# Altium schematic sheet main.SchDoc
size A3; SheetNumber: 1; SheetTotal: 3
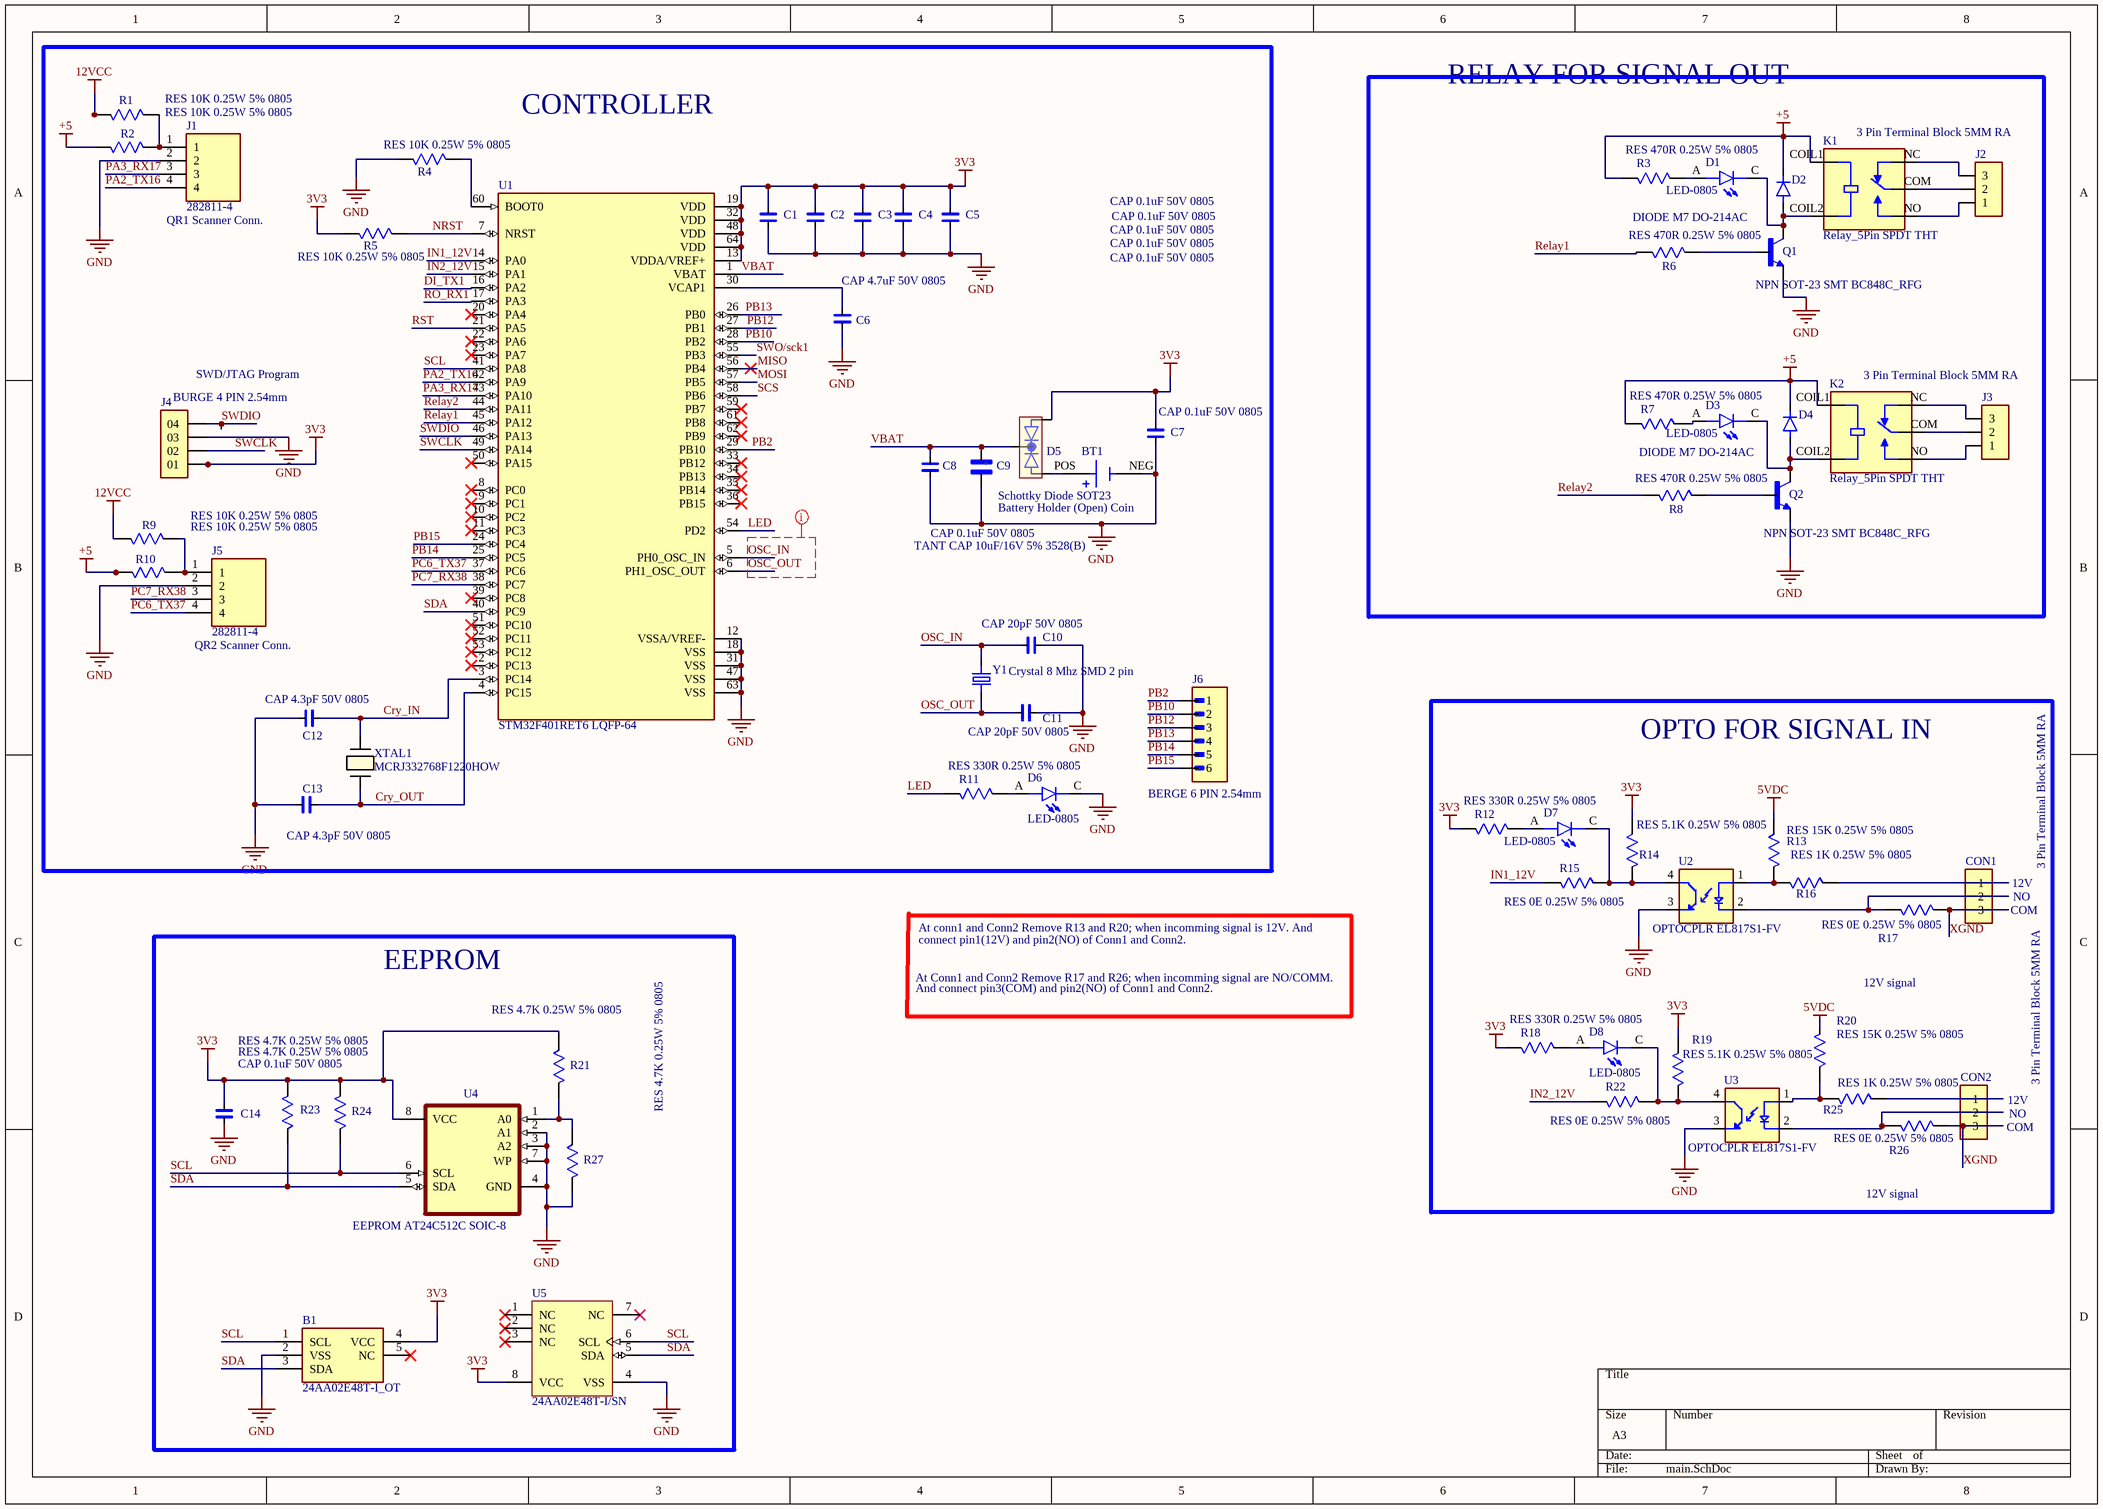
[diagram p0: main.SchDoc]

## Parts
B1  24AA02E48T-I_OT  [SOT95P270X145-5N]
BT1  Battery Holder (Open) Coin  [Battery Holder (Open) Coin]
C1  CAP 0.1uF 50V 0805  [CAP CER 0.1uF/50V 5%]
C2  CAP 0.1uF 50V 0805  [CAP CER 0.1uF/50V 5%]
C3  CAP 0.1uF 50V 0805  [CAP CER 0.1uF/50V 5%]
C4  CAP 0.1uF 50V 0805  [CAP CER 0.1uF/50V 5%]
C5  CAP 0.1uF 50V 0805  [CAP CER 0.1uF/50V 5%]
C6  CAP 4.7uF 50V 0805  [CAP CER 0.1uF/50V 5%]
C7  CAP 0.1uF 50V 0805  [CAP CER 0.1uF/50V 5%]
C8  CAP 0.1uF 50V 0805  [CAP CER 0.1uF/50V 5%]
C9  TANT CAP 10uF/16V 5% 3528(B)  [TANT CAP 3528(B)]
C10  CAP 20pF 50V 0805  [CAP CER 0.1uF/50V 5%]
C11  CAP 20pF 50V 0805  [CAP CER 0.1uF/50V 5%]
C12  CAP 4.3pF 50V 0805  [CAP CER 0.1uF/50V 5%]
C13  CAP 4.3pF 50V 0805  [CAP CER 0.1uF/50V 5%]
C14  CAP 0.1uF 50V 0805  [CAP CER 0.1uF/50V 5%]
CON1  3 Pin Terminal Block 5MM RA  [3 Pin Terminal Block 5MM RA]
CON2  3 Pin Terminal Block 5MM RA  [3 Pin Terminal Block 5MM RA]
D1  LED-0805  [LED-0805]
D2  DIODE M7 DO-214AC  [DIODE M7 DO-214AC]
D3  LED-0805  [LED-0805]
D4  DIODE M7 DO-214AC  [DIODE M7 DO-214AC]
D5  Schottky Diode SOT23  [Schottky Diode SOT23 BAT54C]
D6  LED-0805  [LED-0805]
D7  LED-0805  [LED-0805]
D8  LED-0805  [LED-0805]
J1  282811-4  [TE_282811-4]
J2  3 Pin Terminal Block 5MM RA  [3 Pin Terminal Block 5MM RA]
J3  3 Pin Terminal Block 5MM RA  [3 Pin Terminal Block 5MM RA]
J4  BURGE 4 PIN 2.54mm  [BURGE 4 PIN 2.54mm]
J5  282811-4  [TE_282811-4]
J6  BERGE 6 PIN 2.54mm  [BERGE 6 PIN 2.54mm]
K1  Relay_5Pin SPDT THT  [Relay_5Pin SPDT THT]
K2  Relay_5Pin SPDT THT  [Relay_5Pin SPDT THT]
Q1  NPN SOT-23 SMT BC848C_RFG  [NPN SOT-23 SMT BC848C_RFG]
Q2  NPN SOT-23 SMT BC848C_RFG  [NPN SOT-23 SMT BC848C_RFG]
R1  RES 10K 0.25W 5% 0805  [RES 0805 10K/0.25W 5%]
R2  RES 10K 0.25W 5% 0805  [RES 0805 10K/0.25W 5%]
R3  RES 470R 0.25W 5% 0805  [RES 0805 10K/0.25W 5%]
R4  RES 10K 0.25W 5% 0805  [RES 0805 10K/0.25W 5%]
R5  RES 10K 0.25W 5% 0805  [RES 0805 10K/0.25W 5%]
R6  RES 470R 0.25W 5% 0805  [RES 0805 10K/0.25W 5%]
R7  RES 470R 0.25W 5% 0805  [RES 0805 10K/0.25W 5%]
R8  RES 470R 0.25W 5% 0805  [RES 0805 10K/0.25W 5%]
R9  RES 10K 0.25W 5% 0805  [RES 0805 10K/0.25W 5%]
R10  RES 10K 0.25W 5% 0805  [RES 0805 10K/0.25W 5%]
R11  RES 330R 0.25W 5% 0805  [RES 0805 10K/0.25W 5%]
R12  RES 330R 0.25W 5% 0805  [RES 0805 10K/0.25W 5%]
R13  RES 15K 0.25W 5% 0805  [RES 0805 10K/0.25W 5%]
R14  RES 5.1K 0.25W 5% 0805  [RES 0805 10K/0.25W 5%]
R15  RES 0E 0.25W 5% 0805  [RES 0805 10K/0.25W 5%]
R16  RES 1K 0.25W 5% 0805  [RES 0805 10K/0.25W 5%]
R17  RES 0E 0.25W 5% 0805  [RES 0805 10K/0.25W 5%]
R18  RES 330R 0.25W 5% 0805  [RES 0805 10K/0.25W 5%]
R19  RES 5.1K 0.25W 5% 0805  [RES 0805 10K/0.25W 5%]
R20  RES 15K 0.25W 5% 0805  [RES 0805 10K/0.25W 5%]
R21  RES 4.7K 0.25W 5% 0805  [RES 0805 10K/0.25W 5%]
R22  RES 0E 0.25W 5% 0805  [RES 0805 10K/0.25W 5%]
R23  RES 4.7K 0.25W 5% 0805  [RES 0805 10K/0.25W 5%]
R24  RES 4.7K 0.25W 5% 0805  [RES 0805 10K/0.25W 5%]
R25  RES 1K 0.25W 5% 0805  [RES 0805 10K/0.25W 5%]
R26  RES 0E 0.25W 5% 0805  [RES 0805 10K/0.25W 5%]
R27  RES 4.7K 0.25W 5% 0805  [RES 0805 10K/0.25W 5%]
U1  STM32F401RET6 LQFP-64  [STM32F401RE Cortex-M4]
U2  OPTOCPLR EL817S1-FV  [OPTOCPLR EL817S1-FV]
U3  OPTOCPLR EL817S1-FV  [OPTOCPLR EL817S1-FV]
U4  EEPROM AT24C512C SOIC-8  [EEPROM AT24C512C SOIC-8]
U5  24AA02E48T-I/SN  [SOIC-SN8_N]
XTAL1  MCRJ332768F1220HOW  [CRYSTAL_MCRJ332768F1220HOW_MTC]
Y1  Crystal 8 Mhz SMD 2 pin  [Crystal 16 Mhz SMD 2 pin]

## Blocks framed on the sheet
CONTROLLER: BT1 C1-C13 D5 D6 J1 J4-J6 R1 R2 R4 R5 R9-R11 U1 XTAL1 Y1
RELAY FOR SIGNAL OUT: D1-D4 J2 J3 K1 K2 Q1 Q2 R3 R6-R8
OPTO FOR SIGNAL IN: CON1 CON2 D7 D8 R12-R20 R22 R25 R26 U2 U3
EEPROM: B1 C14 R21 R23 R24 R27 U4 U5

## Nets
3V3: B1.4(VCC) C1.2 C2.2 C3.2 C4.2 C5.2 C7.2 C14.2 D5.1(A1) J4.01 R5.1 R12.2 R14.1 R18.2 R19.1 R21.2 R23.2 R24.2 U1.13(VDDA/VREF+) U1.19(VDD) U1.32(VDD) U1.48(VDD) U1.64(VDD) U4.8(VCC) U5.8(VCC)
5VDC: R13.1 R20.1
12VCC: R1.1 R9.1
+5: D2.C(K) D4.C(K) K1.COIL1 K2.COIL1 R2.1 R3.2 R7.2 R10.1
GND: B1.2(VSS) BT1.NEG C1.1 C2.1 C3.1 C4.1 C5.1 C6.1 C7.1 C8.1 C9.2 C10.2 C11.2 C12.2 C13.2 C14.1 D6.C J1.2 J4.03 J5.2 Q1.2(E) Q2.2(E) R4.1 R27.1 U1.12(VSSA/VREF-) U1.18(VSS) U1.31(VSS) U1.47(VSS) U1.63(VSS) U2.3(ET) U3.3(ET) U4.2(A1) U4.3(A2) U4.4(GND) U4.7(WP) U5.4(VSS)
Cry_IN: C12.1 U1.3(PC14) XTAL1.1
Cry_OUT: C13.1 U1.4(PC15) XTAL1.2
DI_TX1: U1.16(PA2)
IN1_12V: R15.2 U1.14(PA0)
IN2_12V: R22.2 U1.15(PA1)
LED: R11.2 U1.54(PD2)
MISO: U1.56(PB4)
MOSI: U1.57(PB5)
NRST: R5.2 U1.7(NRST)
OSC_IN: C10.1 U1.5(PH0_OSC_IN) Y1.2
OSC_OUT: C11.1 U1.6(PH1_OSC_OUT) Y1.1
PA2_TX16: J1.4 U1.42(PA9)
PA3_RX17: J1.3 U1.43(PA10)
PB2: J6.1 U1.29(PB10)
PB10: J6.2 U1.28(PB2)
PB12: J6.3 U1.27(PB1)
PB13: J6.4 U1.26(PB0)
PB14: J6.5 U1.25(PC5)
PB15: J6.6 U1.24(PC4)
PC6_TX37: J5.4 U1.37(PC6)
PC7_RX38: J5.3 U1.38(PC7)
Relay1: R6.1 U1.45(PA12)
Relay2: R8.1 U1.44(PA11)
RO_RX1: U1.17(PA3)
RST: U1.21(PA5)
SCL: B1.1(SCL) R24.1 U1.41(PA8) U4.6(SCL) U5.6(SCL)
SCS: U1.58(PB6)
SDA: B1.3(SDA) R23.1 U1.40(PC9) U4.5(SDA) U5.5(SDA)
SWCLK: J4.02 U1.49(PA14)
SWDIO: J4.04 U1.46(PA13)
SWO/sck1: U1.55(PB3)
VBAT: C8.2 C9.1 D5.3(C) U1.1(VBAT)
XGND: CON1.3 CON2.3 R17.1 R26.1
NetBT1_POS: BT1.POS D5.2(A2)
NetC6_2: C6.2 U1.30(VCAP1)
NetCON1_1: CON1.1 R16.1
NetCON1_2: CON1.2 R17.2 U2.2(C)
NetCON2_1: CON2.1 R25.1
NetCON2_2: CON2.2 R26.2 U3.2(C)
NetD1_A: D1.A R3.1
NetD1_C: D1.C D2.A K1.COIL2 Q1.3(C)
NetD3_A: D3.A R7.1
NetD3_C: D3.C D4.A K2.COIL2 Q2.3(C)
NetD6_A: D6.A R11.1
NetD7_A: D7.A R12.1
NetD7_C: D7.C R14.2 R15.1 U2.4(CT)
NetD8_A: D8.A R18.1
NetD8_C: D8.C R19.2 R22.1 U3.4(CT)
NetJ1_1: J1.1 R1.2 R2.2
NetJ2_1: J2.1 K1.NO
NetJ2_2: J2.2 K1.COM
NetJ2_3: J2.3 K1.NC
NetJ3_1: J3.1 K2.NO
NetJ3_2: J3.2 K2.COM
NetJ3_3: J3.3 K2.NC
NetJ5_1: J5.1 R9.2 R10.2
NetQ1_1: Q1.1(B) R6.2
NetQ2_1: Q2.1(B) R8.2
NetR4_2: R4.2 U1.60(BOOT0)
NetR13_2: R13.2 R16.2 U2.1(A)
NetR20_2: R20.2 R25.2 U3.1(A)
NetR21_1: R21.1 R27.2 U4.1(A0)

Not connected (* = marked no-connect by the designer): B1 5(NC)*; U1 2(PC13)* 8(PC0)* 9(PC1)* 10(PC2)* 11(PC3)* 20(PA4)* 22(PA6)* 23(PA7)* 33(PB12)* 34(PB13)* 35(PB14)* 36(PB15)* 39(PC8)* 50(PA15)* 51(PC10)* 52(PC11)* 53(PC12)* 59(PB7)* 61(PB8)* 62(PB9)*; U5 1(NC)* 2(NC)* 3(NC)* 7(NC)*

## Layout directives
net class Single_50 ohm: OSC_IN, OSC_OUT

## Notes on the sheet
- (near J1) QR1 Scanner Conn.
- (near J4) SWD/JTAG Program
- (near J5) QR2 Scanner Conn.
- (near CON1) COM
- (near CON1) 12V
- (near CON1) NO
- At Conn1 and Conn2 Remove R17 and R26; when incomming signal are NO/COMM.
- And connect pin3(COM) and pin2(NO) of Conn1 and Conn2.
- At conn1 and Conn2 Remove R13 and R20; when incomming signal is 12V. And
- connect pin1(12V) and pin2(NO) of Conn1 and Conn2.
- 12V signal
- (near CON2) 12V
- (near CON2) NO
- (near CON2) COM
- (in symbol TANT CAP 10uF/16V 5% 3528(B)) +

## Library data of the parts
B1 = 24AA02E48T-I_OT: 2K 256X8 1.8V Ser.EEPROM,24AA02E48T-I/OT; Manufacturer_Name: Microchip; Geometry.Height: 1.45mm; Manufacturer_Part_Number: 24AA02E48T-I/OT; Mouser Part Number: 579-24AA02E48TIOT; Mouser Price/Stock: https://www.mouser.co.uk/ProductDetail/Microchip-Technology/24AA02E48T-I-OT?qs=h8kCHL4kpM5dzsPTuTrxSQ%3D%3D; Arrow Part Number: 24AA02E48T-I/OT; Arrow Price/Stock: https://www.arrow.com/en/products/24aa02e48t-iot/microchip-technology?utm_currency=USD&region=nac; Datasheet Link: https://datasheet.datasheetarchive.com/originals/distributors/SFDatasheet-11/sf-000234844.pdf
BT1 = Battery Holder (Open) Coin: Battery Holder (Open) Coin, 20.0mm 1 Cell SMD (SMT) Tab, CR2032, BS-7-RED; Package: None; Price: None; Value: *; MP: BS-7-RED; Availability: Unavailable
C1-C8 C10-C14 = CAP CER 0.1uF/50V 5%: CAP CER 0.1uF/50V  Ceramic Capacitor X7R 0805 (2012 Metric) SMT; MF: Samsung; MP: CL21B104KCFNNNE; Purchase-URL: https://pricing.snapeda.com/search?q=CL21B104KCFNNNE&ref=eda; Package: 0805 Samsung; Check_prices: https://www.snapeda.com/parts/CL21B104KCFNNNE/Samsung+Electro-Mechanics/view-part/?ref=eda; Value: *; SnapEDA_Link: https://www.snapeda.com/parts/CL21B104KCFNNNE/Samsung+Electro-Mechanics/view-part/?ref=snap; Digi-Key_Part_Number: 1276-6840-2-ND
C9 = TANT CAP 10uF/16V 5% 3528(B): 10 ÂµF Molded Tantalum Polymer Capacitor 25 V 1411 (3528 Metric), 1210 150mOhm TCJB106M025R0150; MF: AVX; SnapEDA_Link: https://www.snapeda.com/parts/TCJB106M025R0150/AVX/view-part/?ref=snap; Package: 1210 AVX; Value: *; MP: TCJB106M025R0150; Check_prices: https://www.snapeda.com/parts/TCJB106M025R0150/AVX/view-part/?ref=eda
CON1 CON2 J2 J3 = 3 Pin Terminal Block 5MM RA: 3 Pin Terminal Block HDR 5MM THT RA 231-433_001-000; MP: 231-433/001-000; MF: WAGO; SnapEDA_Link: https://www.snapeda.com/parts/231-433/001-000/WAGO/view-part/482062/?ref=snap; Package: None; Availability: Unavailable; Price: None; Value: *
D1 D3 D6-D8 = LED-0805: Red 640nm LED Indication - Discrete 1.85V 0805 (2012 Metric) APT2012SRCPRV; MF: Kingbright; SnapEDA_Link: https://www.snapeda.com/parts/APT2012SRCPRV/Kingbright/view-part/?ref=snap; Package: 0805 Kingbright; Value: *; MP: APT2012SRCPRV; Check_prices: https://www.snapeda.com/parts/APT2012SRCPRV/Kingbright/view-part/?ref=eda
D2 D4 = DIODE M7 DO-214AC: M7 General Purpose SMD Rectifier Diode SMA (DO-214AC) 1A 1000V 1n4007 RS2MA; MF: Taiwan Semiconductor; SnapEDA_Link: https://www.snapeda.com/parts/RS2MA/Taiwan+Semiconductor/view-part/?ref=snap; Package: DO-214AC-2 Taiwan Semiconductor; Value: *; MP: RS2MA; Check_prices: https://www.snapeda.com/parts/RS2MA/Taiwan+Semiconductor/view-part/?ref=eda
D5 = Schottky Diode SOT23 BAT54C: Schottky Diode 2x ComCath 0.2A 30V SOT23 | Diodes Inc BAT54C; MF: Diodes Inc.; MP: BAT54C-7-F; SnapEDA_Link: https://www.snapeda.com/parts/BAT54C-7-F/Diodes+Inc./view-part/?ref=snap; Package: SOT-23 Diodes Inc.; Value: *; Check_prices: https://www.snapeda.com/parts/BAT54C-7-F/Diodes+Inc./view-part/?ref=eda
J1 J5 = 282811-4: 4 Position Terminal Block Header, Male Pins, Shrouded (2 Side) 0.197 (5.00mm) 90Â°, Right Angle Through Hole; Centerline_Pitch: 5 mm[.197 in]; MF: TE Connectivity; Number_of_Positions: 4; SnapEDA_Link: https://www.snapeda.com/parts/282811-4/TE%20Connectivity%20AMP%20Connectors/view-part/2383458/?ref=snap; Price: None; Mouser-Purchase-URL: https://snapeda.com/shop?store=Mouser&id=2383458; DigiKey-Purchase-URL: https://snapeda.com/shop?store=DigiKey&id=2383458; Value: *; MP: 282811-4; Package: None; EU_RoHS_Compliance: Compliant; Availability: Good
J4 = BURGE 4 PIN 2.54mm: Conn Unshrouded Header HDR 4 POS 2.54mm Solder ST Top Entry Thru-Hole Bulk TSW-104-17-G-S-LL; MF: Samtec; MP: TSW-104-23-H-S-LL; SnapEDA_Link: https://www.snapeda.com/parts/TSW-104-23-H-S-LL/Samtec/view-part/?ref=snap; Package: None; Value: *; Check_prices: https://www.snapeda.com/parts/TSW-104-23-H-S-LL/Samtec/view-part/?ref=eda
J6 = BERGE 6 PIN 2.54mm: BergStik, Board to Board connector, Unshrouded Vertical Header, Through Hole, Single Row, 6 Positions, 2.54 mm (0.100in) Pitch. 68604-406HLF; MF: AMPHENOL ICC / FCI; SnapEDA_Link: https://www.snapeda.com/parts/68604-406HLF/Amphenol/view-part/?ref=snap; Package: None; Value: *; MP: 68604-406HLF; Check_prices: https://www.snapeda.com/parts/68604-406HLF/Amphenol/view-part/?ref=eda
K1 K2 = Relay_5Pin SPDT THT: Relays General Purpose Non Latching 3VDC SPDT 10A (250VAC) Max 5PIN SRD-03VDC-SL-C; MF: Songle Relay; SnapEDA_Link: https://www.snapeda.com/parts/SRD-03VDC-SL-C/Songle+Relay/view-part/?ref=snap; Package: NON STANDARD-5 Songle Relay; Value: *; MP: SRD-03VDC-SL-C; Check_prices: https://www.snapeda.com/parts/SRD-03VDC-SL-C/Songle+Relay/view-part/?ref=eda
Q1 Q2 = NPN SOT-23 SMT BC848C_RFG: NPN SMT BC848C_RFG SOT-23, 30V, 0.1A, NPN Transistor; MF: Taiwan Semiconductor; MP: BC848C RFG; SnapEDA_Link: https://www.snapeda.com/parts/BC848C%20RFG/Taiwan+Semiconductor/view-part/?ref=snap; Package: SOT-23 Taiwan Semiconductor; Value: *; Check_prices: https://www.snapeda.com/parts/BC848C%20RFG/Taiwan+Semiconductor/view-part/?ref=eda
R1-R27 = RES 10K 0.25W 5% 0805: RESISTOR, THICK FILM, 10K, 5%, 0805 0.25W SMT; MP: ERJ-6GEYJ103V; MF: Panasonic Electronic; Price: None; Check_prices: https://www.snapeda.com/parts/ERJ-6GEYJ103V/Panasonic+Electronic+Components/view-part/?ref=eda; Package: 805-2 Panasonic; Purchase-URL: https://pricing.snapeda.com/search/part/ERJ-6GEYJ103V/?ref=eda; Availability: In Stock; SnapEDA_Link: https://www.snapeda.com/parts/ERJ-6GEYJ103V/Panasonic+Electronic+Components/view-part/?ref=snap; Value: *
U1 = STM32F401RET6: ARMÂ® CortexÂ®-M4 STM32F4 Microcontroller IC 32-Bit Single-Core 84MHz 512KB (512K x 8) FLASH 64-LQFP (10x10); MF: STMicroelectronics; SnapEDA_Link: https://www.snapeda.com/parts/STM32F401RET6/STMicroelectronics/view-part/?ref=snap; Package: LQFP-64 STMicroelectronics; Value: *; MP: STM32F401RET6; Check_prices: https://www.snapeda.com/parts/STM32F401RET6/STMicroelectronics/view-part/?ref=eda
U2 U3 = Optclr EL817S1-FV: Optoisoltr 5kv Transistor 4-Smd EL817S1-FV; MF: {'manufacturer': u'Everlight Electronics Co Ltd'}; MP: EL817S1(A)(TU)-V; Package: None; Price: None; Value: *; Availability: Unavailable
U4 = EEPROM AT24C512C SOIC-8: EEPROM Memory IC 512Kb (64K x 8) IÂ²C 400 kHz 900 ns SOIC-8 AT24C512C-SSHM-T; MF: Microchip; SnapEDA_Link: https://www.snapeda.com/parts/AT24C512C-SSHM-T/Microchip/view-part/?ref=snap; Package: SO-8 Microchip; Value: *; MP: AT24C512C-SSHM-T; Check_prices: https://www.snapeda.com/parts/AT24C512C-SSHM-T/Microchip/view-part/?ref=eda
U5 = CMP-0159-00177-1: 2Kbit, 400kHz, 1.7V, I2C Serial EEPROM with EUI-48 Node Identity, 8-Pin SOIC 150mil, Industrial Temperature, Tape and Reel; PackageReference: SOIC-SN8; DatasheetVersion: revB, Jan-2009; PackageDescription: 8-Lead Plastic Small Outline (SN) - Narrow, 3.90mm Body [SOIC]; PackageVersion: revBB, Aug-2009; Code_IPC: SOIC127P600-8; Code_JEDEC: MS-012
XTAL1 = MCRJ332768F1220HOW: No Description Available; Manufacturer_Name: Multicomp; Copyright: Copyright (C) 2026 Ultra Librarian. All rights reserved.; Manufacturer_Part_Number: MCRJ332768F1220HOW
Y1 = Crystal 16 Mhz SMD 2 pin_1: 16 MHz Â±30ppm Crystal 20pF 60 Ohms HC-49/US FOXSDLF/128-20 16 Mhz Crystal SMD –CSM-4ALX(28ALX) 12.5mmX4.85mmX4mm; MF: Fox Electronics; SnapEDA_Link: https://www.snapeda.com/parts/FOXSDLF/128-20/Fox+Electronics/view-part/?ref=snap; Package: HC49SD Fox Electronics; Value: *; MP: FOXSDLF/128-20; Check_prices: https://www.snapeda.com/parts/FOXSDLF/128-20/Fox+Electronics/view-part/?ref=eda